# Altium project Motor Controller PCB.PrjPcb
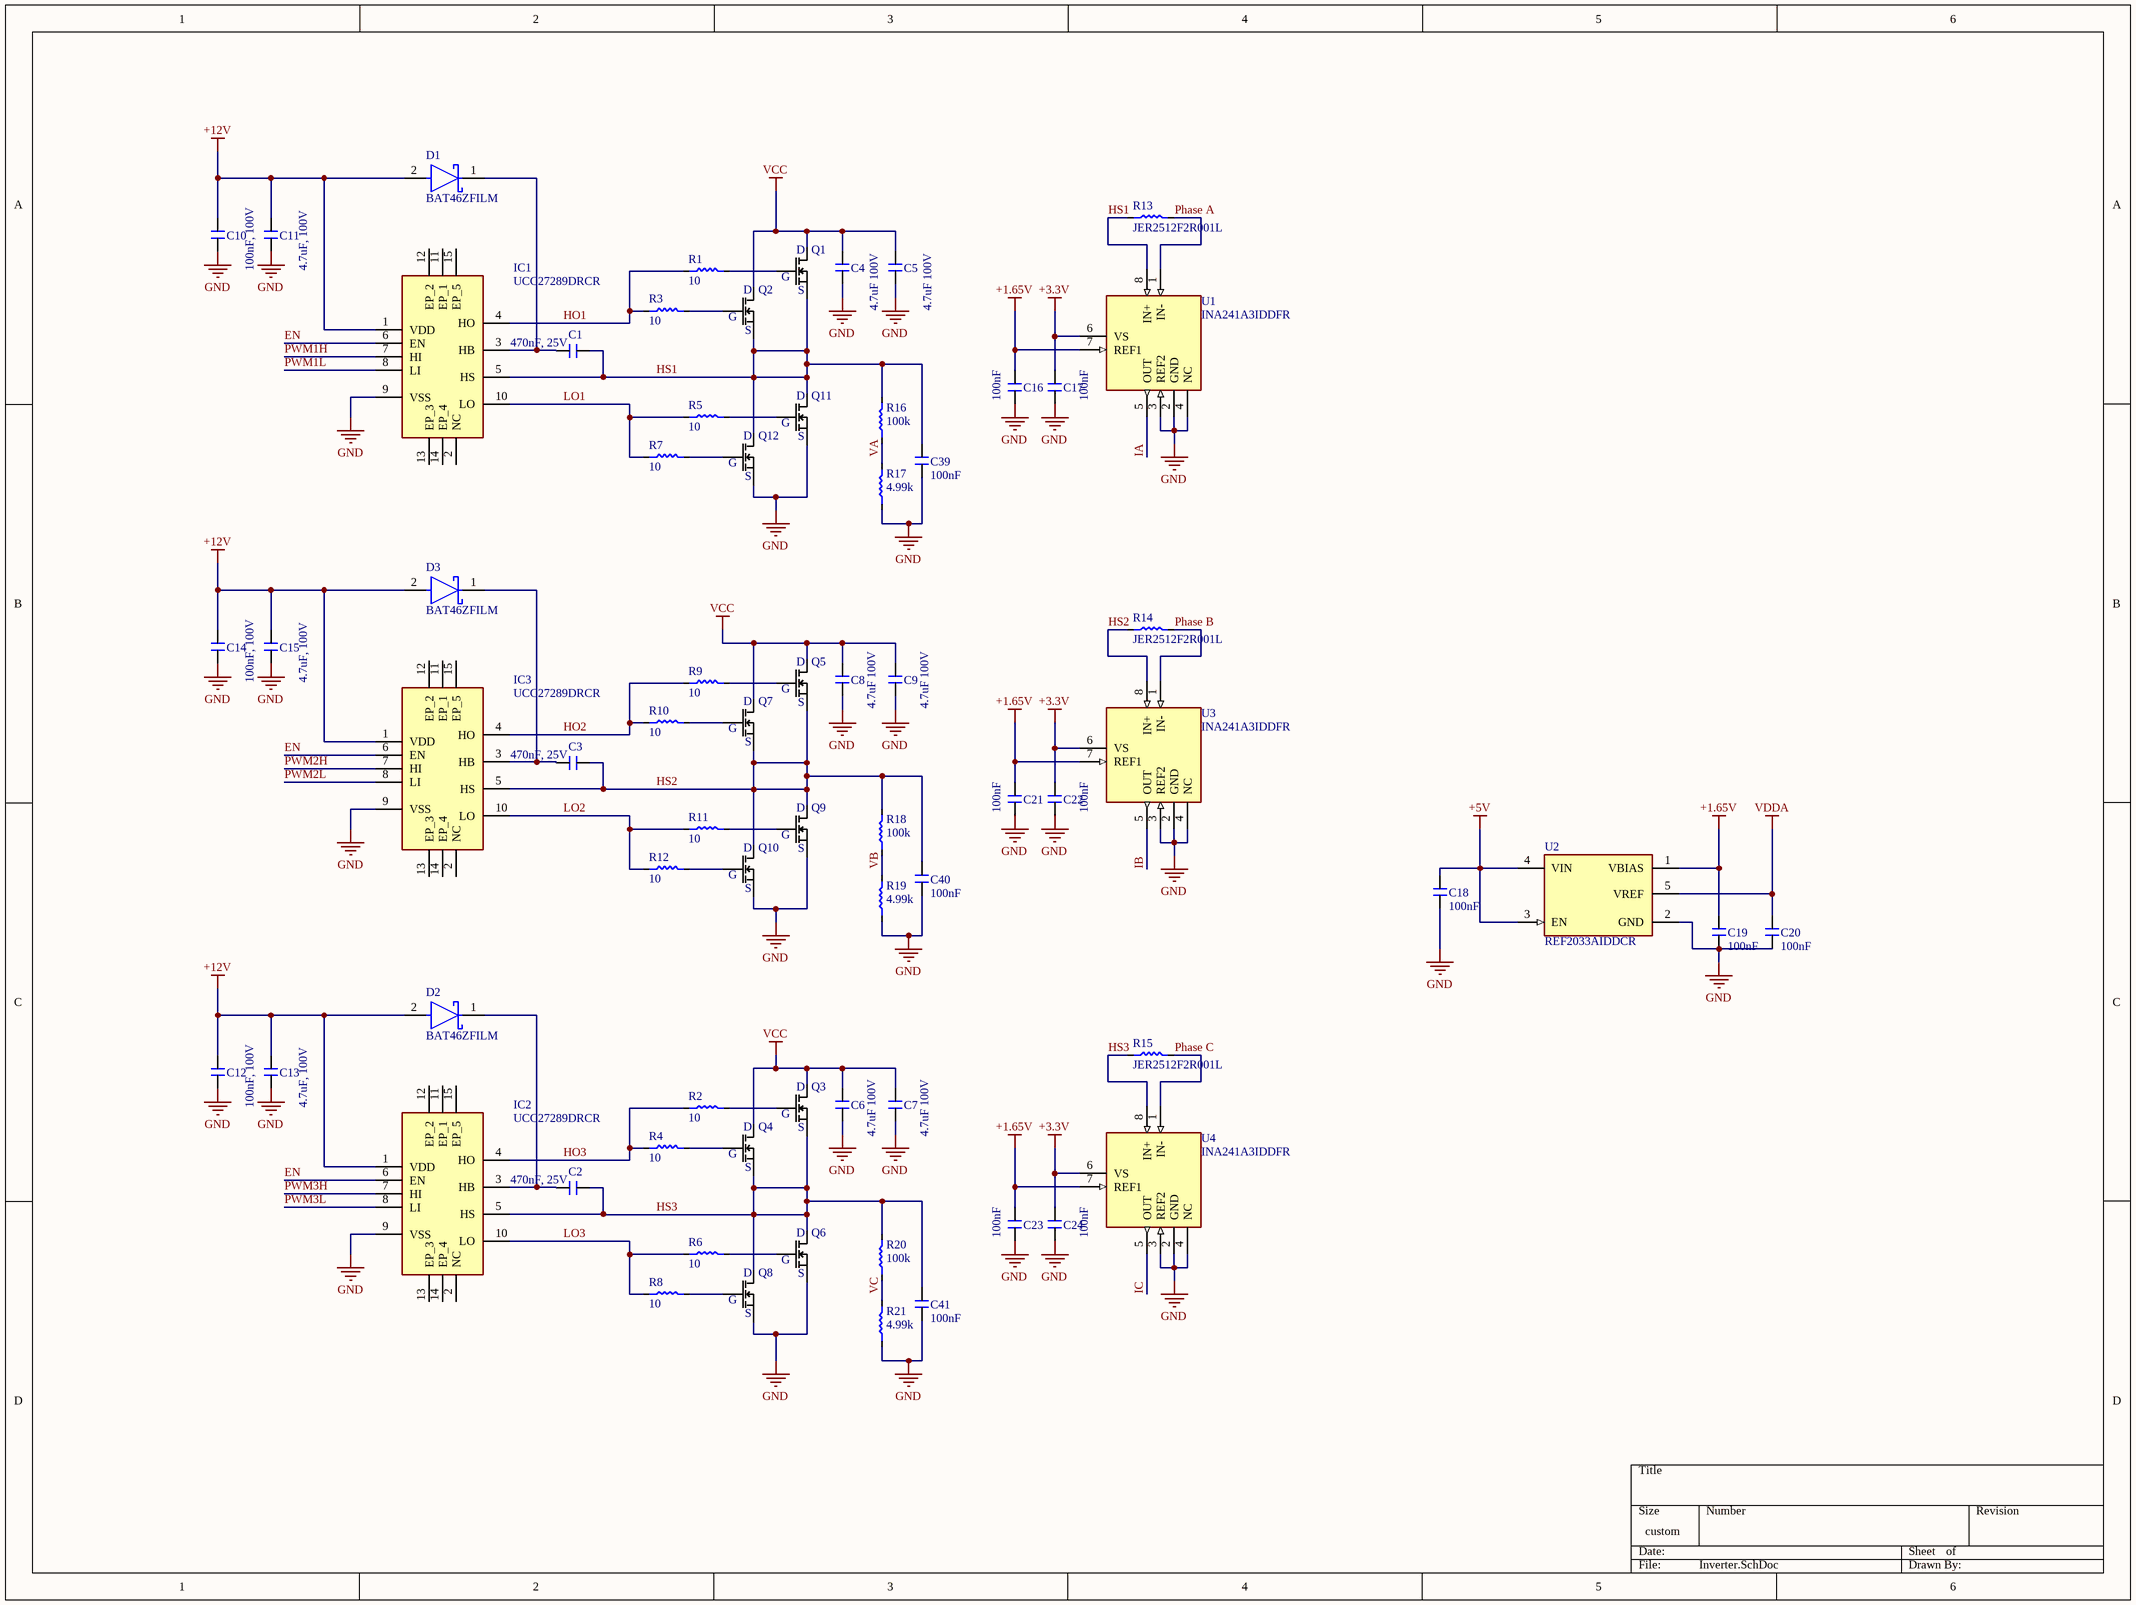
[diagram p0: Inverter.SchDoc]
4 sheets, 147 parts. Net scope: global (net labels, ports and power ports of the same name join across sheets).
Board file: Copy of Motor Controller.PcbDoc
Sheets:
  Inverter.SchDoc
  stm32f407.SchDoc
  Buck Converters.SchDoc
  Encoder.SchDoc

## Sheet Inverter.SchDoc
size 400 x 299 mm; SheetNumber: 1; SheetTotal: 2

### Parts
(Parts that share a designator on the sheet are numbered #1, #2 ... from top to bottom, then left to right.)
C1  470nF, 25V  [C_0805]
C2  470nF, 25V  [C_0805]
C3  470nF, 25V  [C_0805]
C4  4.7uF 100V  [C_1210]
C5  4.7uF 100V  [C_1210]
C6  4.7uF 100V  [C_1210]
C7  4.7uF 100V  [C_1210]
C8  4.7uF 100V  [C_1210]
C9  4.7uF 100V  [C_1210]
C10  100nF, 100V  [C_0805]
C11  4.7uF, 100V  [C_0805]
C12  100nF, 100V  [C_0805]
C13  4.7uF, 100V  [C_0805]
C14  100nF, 100V  [C_0805]
C15  4.7uF, 100V  [C_0805]
C16  100nF  [C_0603]
C17  100nF  [C_0603]
C18  100nF  [C_0603]
C19  100nF  [C_0603]
C20  100nF  [C_0603]
C21  100nF  [C_0603]
C22  100nF  [C_0603]
C23  100nF  [C_0603]
C24  100nF  [C_0603]
C39  100nF  [C_0603]
C40  100nF  [C_0603]
C41  100nF  [C_0603]
D1  BAT46ZFILM  [FP-SOD-123-MFG]
D2#1  BAT46ZFILM  [FP-SOD-123-MFG]
D3  BAT46ZFILM  [FP-SOD-123-MFG]
IC1#1  UCC27289DRCR  [TPS51200MDRCTEP]
IC2  UCC27289DRCR  [TPS51200MDRCTEP]
IC3  UCC27289DRCR  [TPS51200MDRCTEP]
Q1  BSZ075N08NS5ATMA1  [BSZ0909LSATMA1]  (value not drawn)
Q2  BSZ075N08NS5ATMA1  [BSZ0909LSATMA1]  (value not drawn)
Q3  BSZ075N08NS5ATMA1  [BSZ0909LSATMA1]  (value not drawn)
Q4  BSZ075N08NS5ATMA1  [BSZ0909LSATMA1]  (value not drawn)
Q5  BSZ075N08NS5ATMA1  [BSZ0909LSATMA1]  (value not drawn)
Q6  BSZ075N08NS5ATMA1  [BSZ0909LSATMA1]  (value not drawn)
Q7  BSZ075N08NS5ATMA1  [BSZ0909LSATMA1]  (value not drawn)
Q8  BSZ075N08NS5ATMA1  [BSZ0909LSATMA1]  (value not drawn)
Q9  BSZ075N08NS5ATMA1  [BSZ0909LSATMA1]  (value not drawn)
Q10  BSZ075N08NS5ATMA1  [BSZ0909LSATMA1]  (value not drawn)
Q11  BSZ075N08NS5ATMA1  [BSZ0909LSATMA1]  (value not drawn)
Q12  BSZ075N08NS5ATMA1  [BSZ0909LSATMA1]  (value not drawn)
R1  10  [R_0402]
R2  10  [R_0402]
R3  10  [R_0402]
R4  10  [R_0402]
R5  10  [R_0402]
R6  10  [R_0402]
R7  10  [R_0402]
R8  10  [R_0402]
R9  10  [R_0402]
R10  10  [R_0402]
R11  10  [R_0402]
R12  10  [R_0402]
R13  JER2512F2R001L  [JER2512F2R001L]
R14  JER2512F2R001L  [JER2512F2R001L]
R15  JER2512F2R001L  [JER2512F2R001L]
R16  100k  [R_0402]
R17  4.99k  [R_0402]
R18  100k  [R_0402]
R19  4.99k  [R_0402]
R20  100k  [R_0402]
R21  4.99k  [R_0402]
U1  INA241A3IDDFR  [SOT65P280X110-8N]
U2  REF2033AIDDCR  [FP-DDC0005A-MFG]
U3  INA241A3IDDFR  [SOT65P280X110-8N]
U4  INA241A3IDDFR  [SOT65P280X110-8N]

### Nets
+1.65V: C16.1 C19.1 C21.1 C23.1 U1.7(REF1) U2.1(VBIAS) U3.7(REF1) U4.7(REF1)
+3.3V: C17.1 C22.1 C24.1 U1.6(VS) U3.6(VS) U4.6(VS)
+5V: C18.1 U2.3(EN) U2.4(VIN)
+12V: C10.1 C11.1 C12.1 C13.1 C14.1 C15.1 D1.2(A) D2#1.2(A) D3.2(A) IC1#1.1(VDD) IC2.1(VDD) IC3.1(VDD)
GND: C4.2 C5.2 C6.2 C7.2 C8.2 C9.2 C10.2 C11.2 C12.2 C13.2 C14.2 C15.2 C16.2 C17.2 C18.2 C19.2 C20.2 C21.2 C22.2 C23.2 C24.2 C39.2 C40.2 C41.2 IC1#1.9(VSS) IC2.9(VSS) IC3.9(VSS) Q6.1,2,3,10(S_1) Q8.1,2,3,10(S_1) Q9.1,2,3,10(S_1) Q10.1,2,3,10(S_1) Q11.1,2,3,10(S_1) Q12.1,2,3,10(S_1) R17.2 R19.2 R21.2 U1.2(GND) U1.3(REF2) U1.4(NC) U2.2(GND) U3.2(GND) U3.3(REF2) U3.4(NC) U4.2(GND) U4.3(REF2) U4.4(NC)
VCC: C4.1 C5.1 C6.1 C7.1 C8.1 C9.1 Q1.5,6,7,8,9(D) Q2.5,6,7,8,9(D) Q3.5,6,7,8,9(D) Q4.5,6,7,8,9(D) Q5.5,6,7,8,9(D) Q7.5,6,7,8,9(D)
VDDA: C20.1 U2.5(VREF)
EN: IC1#1.6(EN) IC2.6(EN) IC3.6(EN)
HO1: IC1#1.4(HO) R1.2 R3.2
HO2: IC3.4(HO) R9.2 R10.2
HO3: IC2.4(HO) R2.2 R4.2
HS1: C1.1 C39.1 IC1#1.5(HS) Q1.1,2,3,10(S_1) Q2.1,2,3,10(S_1) Q11.5,6,7,8,9(D) Q12.5,6,7,8,9(D) R13.2 R16.1 U1.8(IN+)
HS2: C3.1 C40.1 IC3.5(HS) Q5.1,2,3,10(S_1) Q7.1,2,3,10(S_1) Q9.5,6,7,8,9(D) Q10.5,6,7,8,9(D) R14.2 R18.1 U3.8(IN+)
HS3: C2.1 C41.1 IC2.5(HS) Q3.1,2,3,10(S_1) Q4.1,2,3,10(S_1) Q6.5,6,7,8,9(D) Q8.5,6,7,8,9(D) R15.2 R20.1 U4.8(IN+)
IA: U1.5(OUT)
IB: U3.5(OUT)
IC: U4.5(OUT)
LO1: IC1#1.10(LO) R5.2 R7.2
LO2: IC3.10(LO) R11.2 R12.2
LO3: IC2.10(LO) R6.2 R8.2
Phase A: R13.1 U1.1(IN-)
Phase B: R14.1 U3.1(IN-)
Phase C: R15.1 U4.1(IN-)
PWM1H: IC1#1.7(HI)
PWM1L: IC1#1.8(LI)
PWM2H: IC3.7(HI)
PWM2L: IC3.8(LI)
PWM3H: IC2.7(HI)
PWM3L: IC2.8(LI)
VA: R16.2 R17.1
VB: R18.2 R19.1
VC: R20.2 R21.1
NetC1_2: C1.2 D1.1(C) IC1#1.3(HB)
NetC2_2: C2.2 D2#1.1(C) IC2.3(HB)
NetC3_2: C3.2 D3.1(C) IC3.3(HB)
NetQ1_4: Q1.4(G) R1.1
NetQ2_4: Q2.4(G) R3.1
NetQ3_4: Q3.4(G) R2.1
NetQ4_4: Q4.4(G) R4.1
NetQ5_4: Q5.4(G) R9.1
NetQ6_4: Q6.4(G) R6.1
NetQ7_4: Q7.4(G) R10.1
NetQ8_4: Q8.4(G) R8.1
NetQ9_4: Q9.4(G) R11.1
NetQ10_4: Q10.4(G) R12.1
NetQ11_4: Q11.4(G) R5.1
NetQ12_4: Q12.4(G) R7.1

Not connected (* = marked no-connect by the designer): IC1#1 2(NC) 11(EP_1) 12(EP_2) 13(EP_3) 14(EP_4) 15(EP_5); IC2 2(NC) 11(EP_1) 12(EP_2) 13(EP_3) 14(EP_4) 15(EP_5); IC3 2(NC) 11(EP_1) 12(EP_2) 13(EP_3) 14(EP_4) 15(EP_5)

### Notes on the sheet
- (in symbol BSZ075N08NS5ATMA1) S

### Library data of the parts
C1-C3 C10-C15 = C_0805: Manufacturer Part No: *; JLCPCB Part No: *
C4-C9 = C_1210
C16-C24 C39-C41 = C_0603
D1 D2#1 D3 = CMP-12187-000006-1: DIODE SCHOTTKY 100V 150MA SOD123; Manufacturer: STMicroelectronics; Max Surge Forward Current: 1A; Capacitance: 10pF; Standoff Height: 0mm; Peak Reverse Current: 5uA; Value: 10pF; Max Junction Temp: +150°C; Automotive: No; Ipc Land Pattern Name: SOD375155X145-2; Device Class L2: Diodes; Device Class L1: Discrete Semiconductors; Temperature Range High: +150°C; ComponentLink2Description: Datasheet; Lead Free: Yes; Digikey Description: DIODE SCHOTTKY 100V 150MA SOD123; RoHS: TRUE; Category: Diode; Max Repetitive Reverse Voltage: 100V; ComponentLink2URL: https://www.st.com/resource/en/datasheet/bat46.pdf; Manufacturer Part Number: BAT46ZFILM; Temperature: to +150°C; Mouser Description: Schottky Diodes & Rectifiers schottky diode; Package: SOD-123; Forward Current: 150mA; Octopart: https://octopart.com/bat46zfilm-stmicroelectronics-658190; Height: 1.45mm; Device Class L3: Schottky Diodes
IC1#1 IC2 IC3 = UCC27289DRCR: Integrated Circuit; Manufacturer_Name: Texas Instruments; Datasheet Link: https://www.ti.com/lit/ds/symlink/ucc27289.pdf?ts=1715220331720&ref_url=https%253A%252F%252Fwww.mouser.tw%252F; Height: 1mm; Manufacturer_Part_Number: UCC27289DRCR; Mouser Part Number: 595-UCC27289DRCR; Mouser Price/Stock: https://www.mouser.co.uk/ProductDetail/Texas-Instruments/UCC27289DRCR?qs=rQFj71Wb1eUTx1xsT8GKBg%3D%3D
Q1-Q12 = BSZ075N08NS5ATMA1: MOSFET (N-Channel); Manufacturer_Name: Infineon; Datasheet Link: https://www.infineon.com/dgdl/Infineon-BSZ075N08NS5-DataSheet-v02_03-EN.pdf?fileId=5546d461454603990145ccd5743e61f8; Height: 1mm; Manufacturer_Part_Number: BSZ075N08NS5ATMA1; Mouser Part Number: 726-BSZ075N08NS5ATMA; Mouser Price/Stock: https://www.mouser.co.uk/ProductDetail/Infineon-Technologies/BSZ075N08NS5ATMA1?qs=3Bi3m9r5MQbCecwbz%252BCetA%3D%3D; Arrow Part Number: BSZ075N08NS5ATMA1; Arrow Price/Stock: https://www.arrow.com/en/products/bsz075n08ns5atma1/infineon-technologies-ag?utm_currency=USD&region=nac
R1-R12 R16-R21 = R_0402
R13-R15 = JER2512F2R001L: RES 1mΩ ±1% 2W 2512; Manufacturer Part No: JIERR JER2512F2R001L; LCSC Part No: C49164682
U1 U3 U4 = INA241A3IDDFR: -5-V to 110-V bidirectional ultraprecise current sense amplifier with enhanced PWM rejection; MF: Texas Instruments; Package: None; Price: None; Check_prices: https://www.snapeda.com/parts/INA241A3IDDFR/Texas+Instruments/view-part/?ref=eda; Value: *; SnapEDA_Link: https://www.snapeda.com/parts/INA241A3IDDFR/Texas+Instruments/view-part/?ref=snap; MP: INA241A3IDDFR; Availability: In Stock; Purchase-URL: https://pricing.snapeda.com/search?q=INA241A3IDDFR&ref=eda
U2 = CMP-04916-000008-1: IC VREF SERIES 1.65V/3.3V 5SOT; Manufacturer: Texas Instruments; Standoff Height: 0mm; Nominal Supply Current: 360uA; Min Supply Voltage: 3.32V; Output Type: Fixed; Number Of Outputs: 2; Output Voltage: 1.65/3.3V; Output Current: 20mA; Max Supply Voltage: 5.5V; Max Junction Temp: +150°C; Automotive: No; Height: 1.1mm; Package: DDC0005A; Reference Type: Series; Manufacturer Part Number: REF2033AIDDCR; Temperature Range High: +125°C; Lead Free: Yes; ComponentLink2Description: Datasheet; Device Class L1: Integrated Circuits (ICs); Category: IC; RoHS: TRUE; Device Class L3: Voltage References; ComponentLink2URL: http://www.ti.com/lit/ds/symlink/ref2033.pdf; Device Class L2: Power Management ICs; Octopart: https://octopart.com/ref2033aiddcr-texas+instruments-46921199; Digikey Description: IC VREF SERIES 1.65V/3.3V 5SOT; Temperature: -40°C to +125°C; Temperature Range Low: -40°C

## Sheet stm32f407.SchDoc
size 599 x 241 mm; SheetNumber: 2; SheetTotal: 4
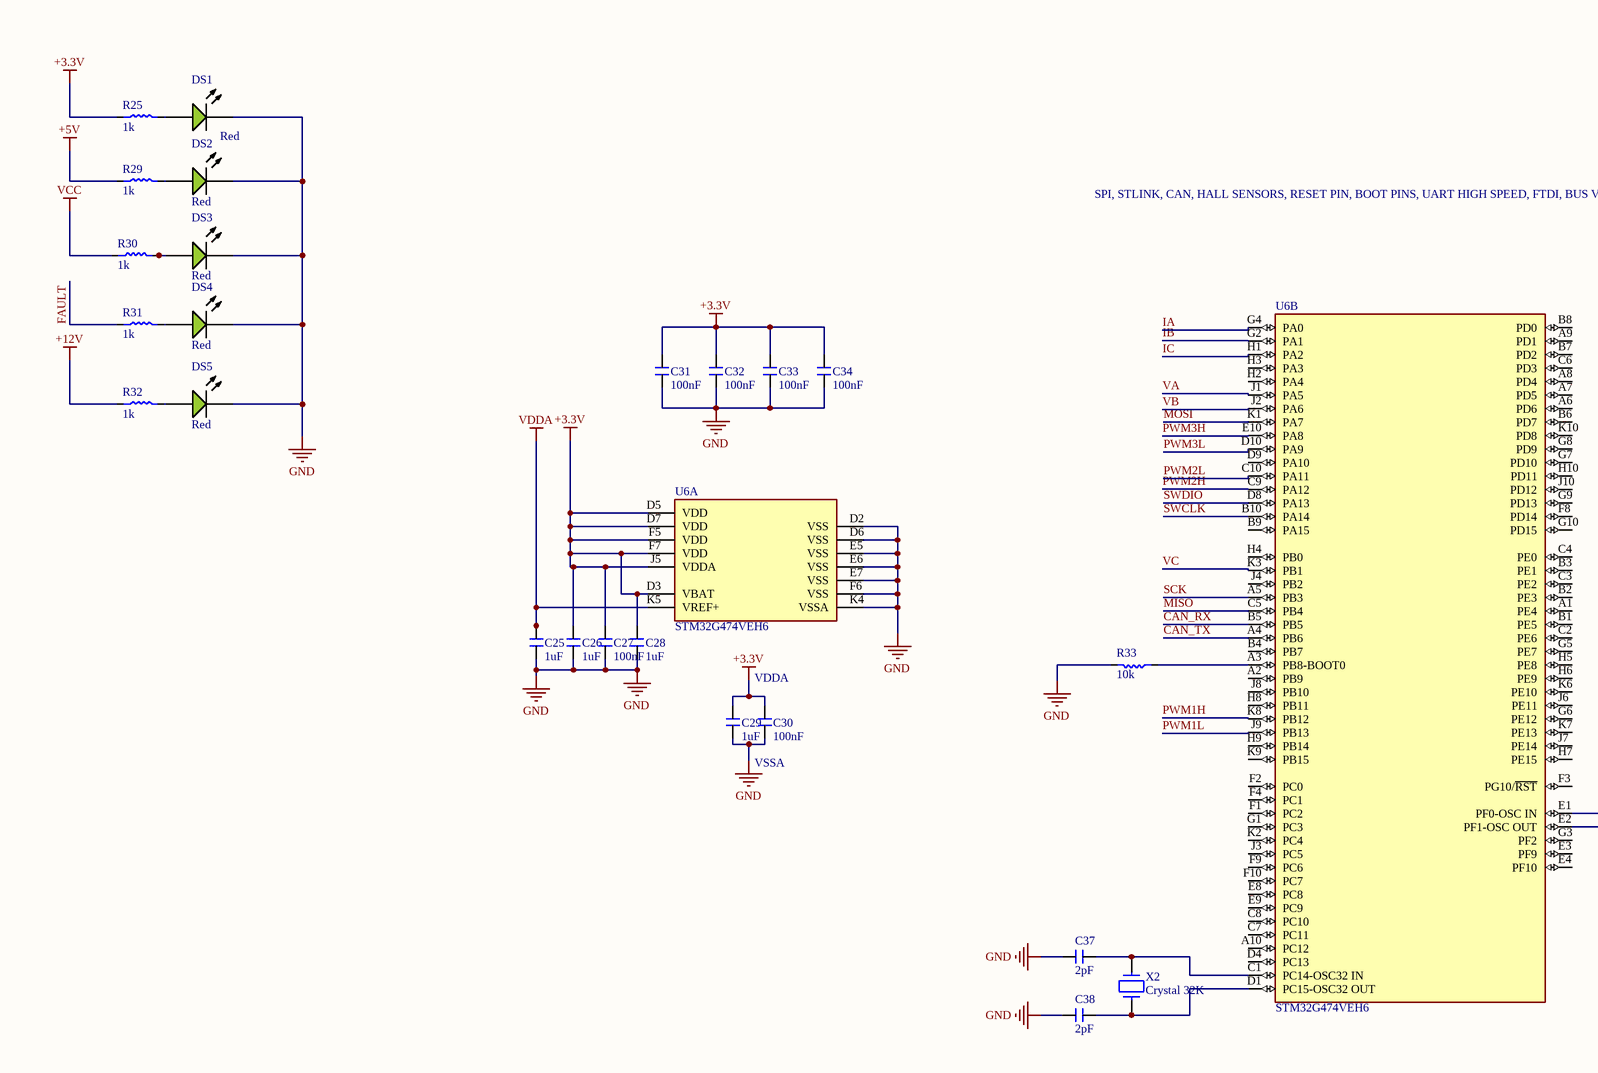
[diagram p1: stm32f407.SchDoc, left]
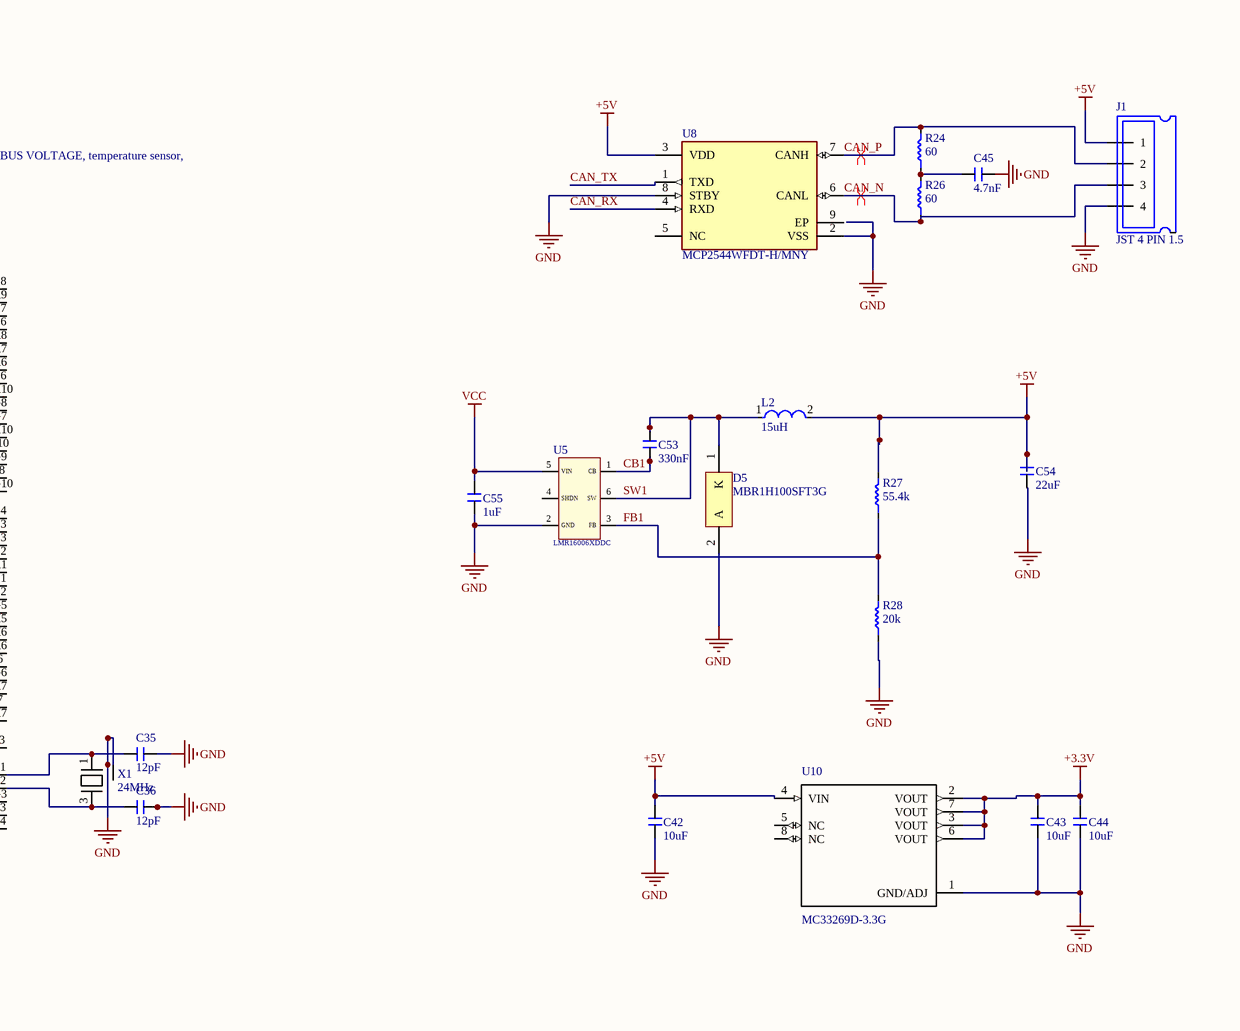
[diagram p2: stm32f407.SchDoc, right]

### Parts
C25  1uF  [C_0402]
C26  1uF  [C_0402]
C27  100nF  [C_0402]
C28  1uF  [C_0402]
C29  1uF  [C_0402]
C30  100nF  [C_0402]
C31  100nF  [C_0402]
C32  100nF  [C_0402]
C33  100nF  [C_0402]
C34  100nF  [C_0402]
C35  12pF  [C_0402]
C36  12pF  [C_0402]
C37  2pF  [C_0402]
C38  2pF  [C_0402]
C42  10uF  [C_0805]
C43  10uF  [C_0805]
C44  10uF  [C_0805]
C45  4.7nF  [C_0402]
C53  330nF  [C_0402]
C54  22uF  [C_0402]
C55  1uF  [C_0402]
D5  MBR1H100SFT3G  [ONSC-SOD-123FL-2-498-01_V]
DS1  Red  [EVRL-0603-2_V]
DS2  Red  [EVRL-0603-2_V]
DS3  Red  [EVRL-0603-2_V]
DS4  Red  [EVRL-0603-2_V]
DS5  Red  [EVRL-0603-2_V]
J1  JST 4 PIN 1.5  [JST 4 PIN 1.5]
L2  15uH  [FP-IHLP-2020CZ-FP_1_905x2-MFG]
R24  60  [R_0402]
R25  1k  [R_0402]
R26  60  [R_0402]
R27  55.4k  [R_0402]
R28  20k  [R_0402]
R29  1k  [R_0402]
R30  1k  [R_0402]
R31  1k  [R_0402]
R32  1k  [R_0402]
R33  10k  [R_0402]
U5  LMR16006XDDC  [SOT95P280X110-6N]  (value not drawn)
U6  STM32G474VEH6  [FP-TFBGA100-A08Q-MFG]  (parts A,B of 2)
U8  MCP2544WFDT-H/MNY  [FP-C04-129-MNY-MFG]
U10  MC33269D-3.3G  [*SOIC127P600X175-8N]
X1  24MHz  [24MHz Crystal]
X2  Crystal 32K  [Crystal 32k]

### Nets
+3.3V: C26.1 C27.2 C28.2 C29.1 C30.2 C31.1 C32.1 C33.1 C34.1 C43.1 C44.1 R25.2 U6.D3(VBAT) U6.D5(VDD) U6.D7(VDD) U6.F5(VDD) U6.F7(VDD) U6.J5(VDDA) U10.2(VOUT) U10.3(VOUT) U10.6(VOUT) U10.7(VOUT)
+5V: C42.1 C54.1 J1.1 L2.2 R27.1 R29.2 U8.3(VDD) U10.4(VIN)
+12V: R32.2
GND: C25.2 C26.2 C27.1 C28.1 C29.2 C30.1 C31.2 C32.2 C33.2 C34.2 C35.2 C36.1 C37.2 C38.1 C42.2 C43.2 C44.2 C45.2 C54.2 C55.2 D5.2(A) DS1.2(K) DS2.2(K) DS3.2(K) DS4.2(K) DS5.2(K) J1.4 R28.2 R33.1 U5.2(GND) U6.D2(VSS) U6.D6(VSS) U6.E5(VSS) U6.E6(VSS) U6.E7(VSS) U6.F6(VSS) U6.K4(VSSA) U8.2(VSS) U8.8(STBY) U10.1(GND/ADJ) X1.2 X1.4
VCC: C55.1 R30.2 U5.5(VIN)
VDDA: C25.1 U6.K5(VREF+)
CAN_N: J1.3 R26.2 U8.6(CANL)
CAN_P: J1.2 R24.1 U8.7(CANH)
CAN_RX: U6.B5(PB5) U8.4(RXD)
CAN_TX: U6.A4(PB6) U8.1(TXD)
CB1: C53.2 U5.1(CB)
FAULT: R31.2
FB1: R27.2 R28.1 U5.3(FB)
IA: U6.G4(PA0)
IB: U6.G2(PA1)
IC: U6.H1(PA2)
MISO: U6.C5(PB4)
MOSI: U6.K1(PA7)
PWM1H: U6.K8(PB12)
PWM1L: U6.J9(PB13)
PWM2H: U6.C9(PA12)
PWM2L: U6.C10(PA11)
PWM3H: U6.E10(PA8)
PWM3L: U6.D10(PA9)
SCK: U6.A5(PB3)
SW1: C53.1 D5.1(K) L2.1 U5.6(SW)
SWCLK: U6.B10(PA14)
SWDIO: U6.D8(PA13)
VA: U6.J1(PA5)
VB: U6.J2(PA6)
VC: U6.K3(PB1)
NetC35_1: C35.1 U6.E1(PF0-OSC_IN) X1.1
NetC36_2: C36.2 U6.E2(PF1-OSC_OUT) X1.3
NetC37_1: C37.1 U6.C1(PC14-OSC32_IN) X2.2
NetC38_2: C38.2 U6.D1(PC15-OSC32_OUT) X2.1
NetC45_1: C45.1 R24.2 R26.1
NetDS1_1: DS1.1(A) R25.1
NetDS2_1: DS2.1(A) R29.1
NetDS3_1: DS3.1(A) R30.1
NetDS4_1: DS4.1(A) R31.1
NetDS5_1: DS5.1(A) R32.1
NetR33_2: R33.2 U6.A3(PB8-BOOT0)

Not connected (* = marked no-connect by the designer): U5 4(SHDN); U6 A1(PE4) A2(PB9) A6(PD6) A7(PD5) A8(PD4) A9(PD1) A10(PC12) B1(PE5) B2(PE3) B3(PE1) B4(PB7) B6(PD7) B7(PD2) B8(PD0) B9(PA15) C2(PE6) C3(PE2) C4(PE0) C6(PD3) C7(PC11) C8(PC10) D4(PC13) D9(PA10) E3(PF9) E4(PF10) E8(PC8) E9(PC9) F1(PC2) F2(PC0) F3(PG10/~{RST}) F4(PC1) F8(PD14) F9(PC6) F10(PC7) G1(PC3) G3(PF2) G5(PE7) G6(PE12) G7(PD10) G8(PD9) G9(PD13) G10(PD15) H2(PA4) H3(PA3) H4(PB0) H5(PE8) H6(PE9) H7(PE15) H8(PB11) H9(PB14) H10(PD11) J3(PC5) J4(PB2) J6(PE11) J7(PE14) J8(PB10) J10(PD12) K2(PC4) K6(PE10) K7(PE13) K9(PB15) K10(PD8); U8 5(NC) 9(EP); U10 5(NC) 8(NC)

### Layout directives
differential pair: CAN_N, CAN_P

### Notes on the sheet
- SPI, STLINK, CAN, HALL SENSORS, RESET PIN, BOOT PINS, UART HIGH SPEED, FTDI, BUS VOLTAGE, temperature sensor,
- VDDA
- VSSA

### Library data of the parts
C25-C38 C45 C53-C55 = C_0402
C42-C44 = C_0805: Manufacturer Part No: *; JLCPCB Part No: *
D5 = CMP-1055-00439-1: Schottky Power Rectifier, 2-Pin SOD-123, Pb-Free, Tape and Reel; Manufacturer: On Semiconductor; IFSM Max (A): 50; Configuration: Single; Mounting Technology: Surface Mount; ComponentLink2Description: Datasheet; ComponentLink3Description: Package Specification; Packing: Tape and Reel; RoHS: TRUE; PartNumber: MBR1H100SFT3G; PackageDescription: 2-Pin SOD, Body 1.65 x 2.7 mm; ComponentLink1Description: Manufacturer URL; ComponentLink2URL: http://www.onsemi.cn/pub_link/Collateral/MBR1H100SF-D.PDF; ComponentLink3URL: http://www.onsemi.cn/pub_link/Collateral/MBR120VLSFT1-D.PDF; PackageVersion: Rev. A; DatasheetVersion: Rev. 1; ComponentLink1URL: http://www.onsemi.com/; PackageReference: SOD-123FL-2-498-01
DS1 = CMP-007-00002-2: Chip LED, Yellow-Green, 5 V, 25 mA, -40 to 85 degC, 2-Pin SMD (0603), RoHS, Tape and Reel; Manufacturer: Everlight Electronics; Forward Voltage: 2V; Lens Style: Clear; Viewing Angle: 120degrees; Colour: Green; Parameter 1: XL-1608SURC-06; Parameter 2: C965799; Mounting Technology: SM; Datasheet Version: Rev. 1, 04/2006; Package Description: 2-Pin Surface Mount Device, Body 1.6 x 0.8 mm; RoHS Compliant: True; Package Reference: 0603; Pins: 2; Manufacturer URL: http://www.everlight.com/; Datasheet URL: https://datasheet.ciiva.com/48679/19-217-g7c-an1p2-3t-48679179.pdf; Case/Package: 0603
DS2-DS5 = CMP-007-00002-2: Chip LED, Yellow-Green, 5 V, 25 mA, -40 to 85 degC, 2-Pin SMD (0603), RoHS, Tape and Reel; Manufacturer: Everlight Electronics; Forward Voltage: 2V; Lens Style: Clear; Viewing Angle: 120degrees; Colour: Green; Mounting Technology: SM; Datasheet Version: Rev. 1, 04/2006; Package Description: 2-Pin Surface Mount Device, Body 1.6 x 0.8 mm; RoHS Compliant: True; Package Reference: 0603; Pins: 2; Manufacturer URL: http://www.everlight.com/; Datasheet URL: https://datasheet.ciiva.com/48679/19-217-g7c-an1p2-3t-48679179.pdf; Case/Package: 0603
L2 = CMP-02424-000144-1: Fixed Inductors Commercial High Saturation Series 15uH 1.9A 265mΩ 20%; Test Frequency: 100kHz; DC Resistance (DCR): 265mR; Saturation Current: 2.5A; Core Material: Metal; Self Resonant Frequency: 5MHz; Shielding: Shielded; Case/Package: 2020; Current Rating: 1.9A; Inductance: 15uH; Height: 3mm; Max Operating Temperature: 125°C; Military Standard: Not; Package Quantity: 2000; Tolerance: 20%; Depth: 5.43mm; Packaging: Tape and Reel; Lead Free: Lead Free; Min Operating Temperature: -55°C; Radiation Hardening: No; Mount: Surface Mount; Height - Seated (Max): 0.118inch; Length: 5.49mm; Width: 0.204inch; Termination: SMD/SMT; Max DC Current: 2.5A
R24-R33 = R_0402
U6 = CMP-12105-000111-1: IC MCU 32BIT 512KB FLSH 100TFBGA; RoHS Compliant: Yes
U8 = CMP-06279-000053-1: IC TRANSCEIVER 1/1 8TDFN; Data Rate: 8Mbps; Receiver Hysteresis: 200mV; RoHS Compliant: Yes; Packaging: Cut Tape; Max Operating Temperature: 150°C; Min Operating Temperature: -40°C; Series: -; Mount: Surface Mount
X1 = 24MHz Crystal
U10 = MC33269D-3.3G: SnapEDA_Link: https://www.snapeda.com/parts/MC33269D-3.3G/Onsemi/view-part/?ref=snap; Check_prices: https://www.snapeda.com/parts/MC33269D-3.3G/Onsemi/view-part/?ref=eda; Value: *

## Sheet Buck Converters.SchDoc
size B; SheetNumber: 3; SheetTotal: 3
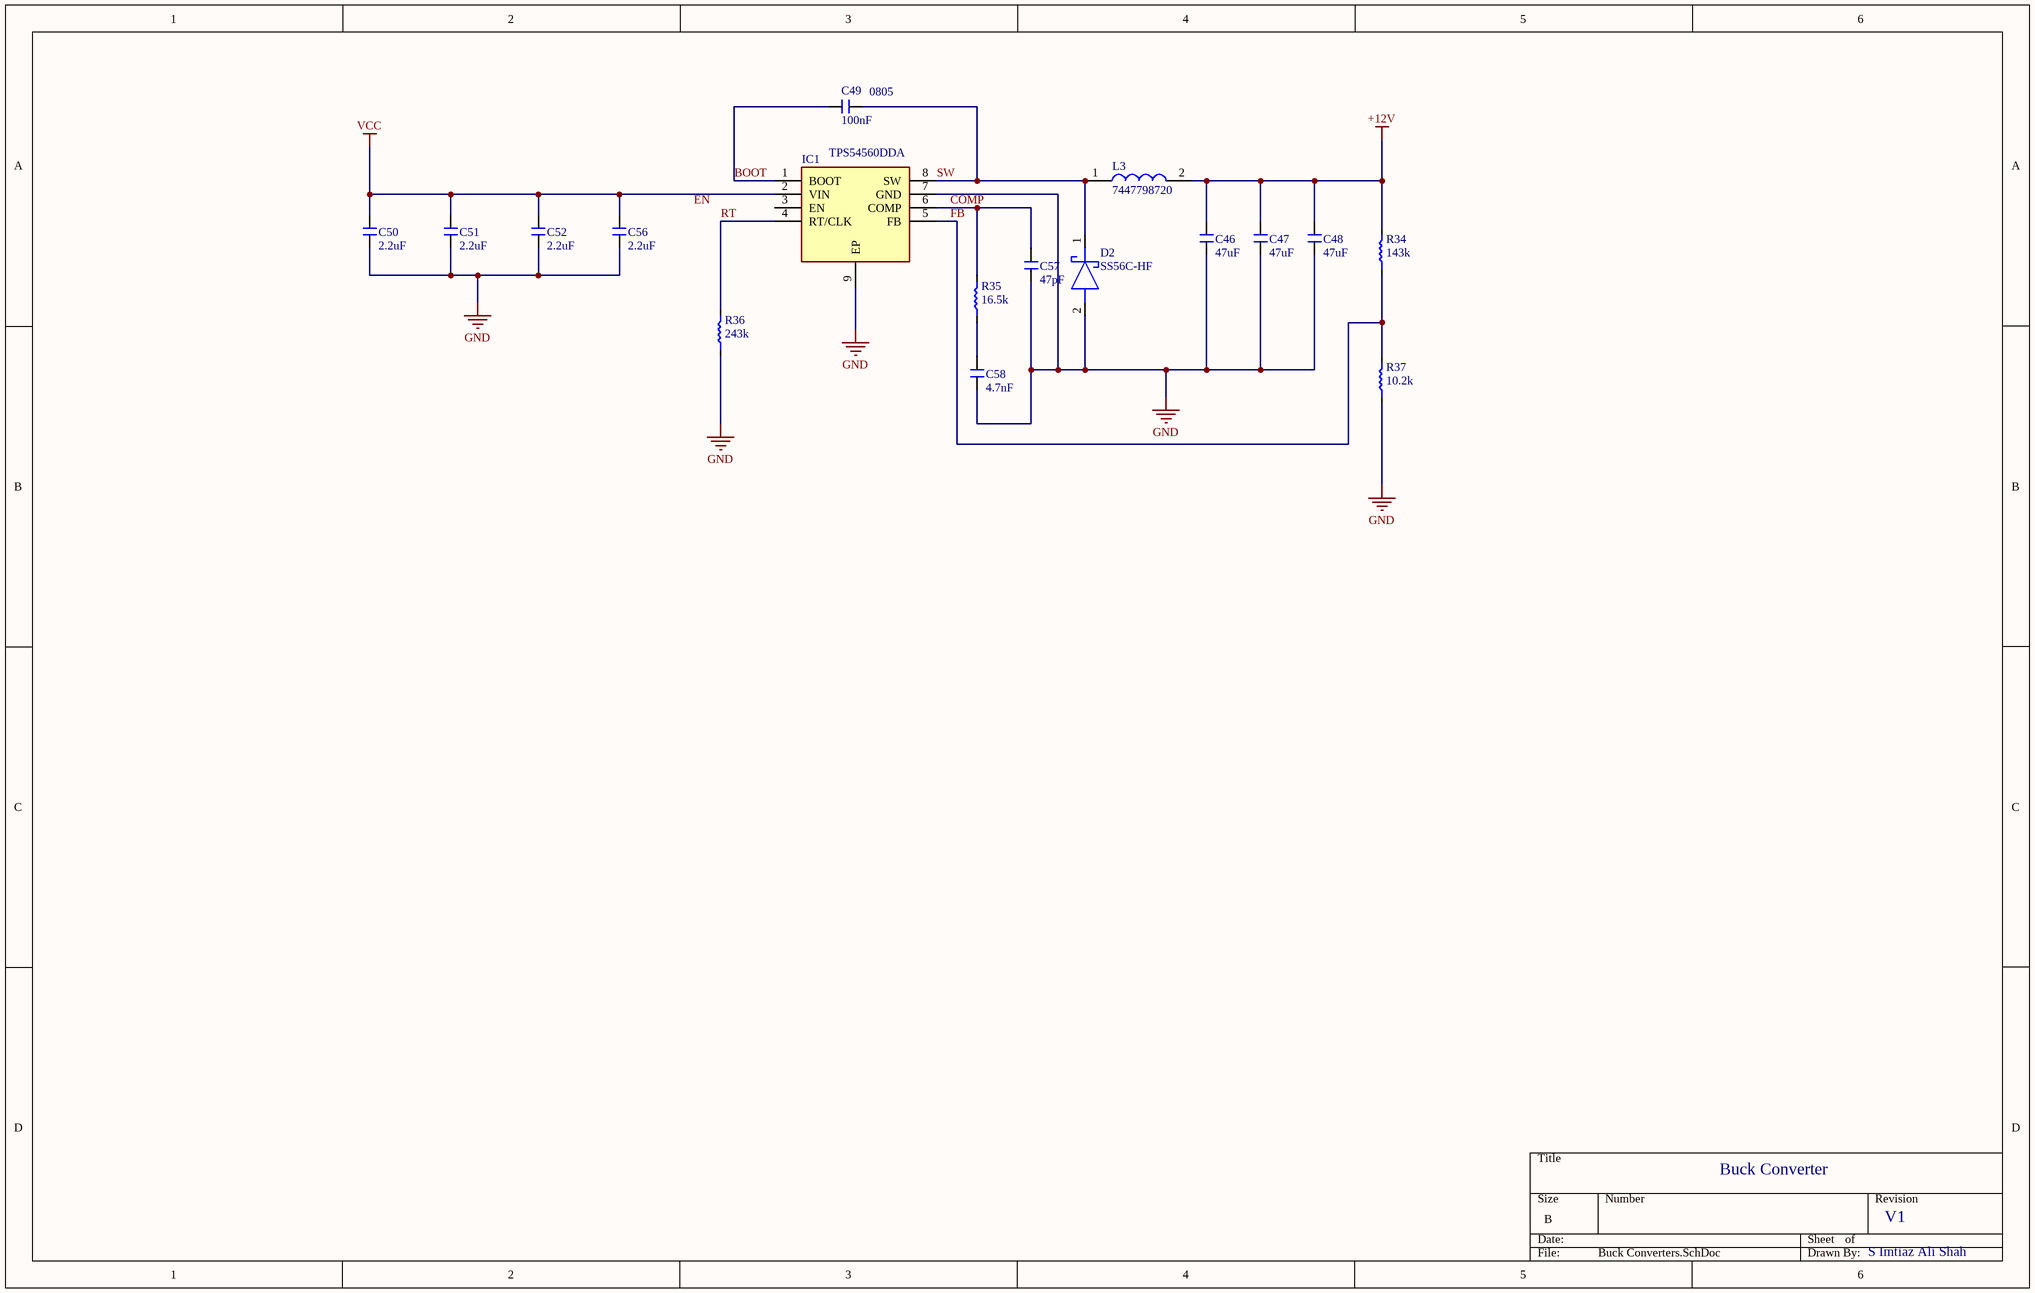
[diagram p3: Buck Converters.SchDoc]

### Parts
(Parts that share a designator on the sheet are numbered #1, #2 ... from top to bottom, then left to right.)
C46  47uF  [C_0603]
C47  47uF  [C_0603]
C48  47uF  [C_0603]
C49  100nF  [C_0603]
C50  2.2uF  [C_0603]
C51  2.2uF  [C_0603]
C52  2.2uF  [C_0603]
C56  2.2uF  [C_0603]
C57  47pF  [C_0402]
C58  4.7nF  [C_0402]
D2#2  SS56C-HF  [DIOM7859X239N]
IC1#2  TPS54560DDA  [SOIC127P600X170-9N]
L3  7447798720  [7447797360]
R34  143k  [R_0402]
R35  16.5k  [R_0402]
R36  243k  [R_0402]
R37  10.2k  [R_0402]

### Nets
+12V: C46.1 C47.1 C48.1 L3.2 R34.1
GND: C46.2 C47.2 C48.2 C50.2 C51.2 C52.2 C56.2 C57.2 C58.2 D2#2.2(A) IC1#2.7(GND) IC1#2.9(EP) R36.2 R37.2
VCC: C50.1 C51.1 C52.1 C56.1 IC1#2.2(VIN)
BOOT: C49.1 IC1#2.1(BOOT)
COMP: C57.1 IC1#2.6(COMP) R35.1
FB: IC1#2.5(FB) R34.2 R37.1
RT: IC1#2.4(RT/CLK) R36.1
SW: C49.2 D2#2.1(K) IC1#2.8(SW) L3.1
NetC58_1: C58.1 R35.2

Not connected (* = marked no-connect by the designer): IC1#2 3(EN)

### Notes on the sheet
- (near C49) 0805
- Buck Converter
- V1
- S Imtiaz Ali Shah
- Labels drawn without touching a wire or pin: EN

### Library data of the parts
C46-C52 C56 = C_0603
C57 C58 = C_0402
D2#2 = SS56C-HF: Schottky Diode; Manufacturer_Name: Comchip Technology; Parameter 1: B560C-13-F; Parameter 2: C85100; Datasheet Link: https://www.comchiptech.com/admin/files/product/20190806171902.pdf; Height: 2.39mm; Manufacturer_Part_Number: SS56C-HF; Mouser Part Number: 750-SS56C-HF; Mouser Price/Stock: https://www.mouser.co.uk/ProductDetail/Comchip-Technology/SS56C-HF?qs=GBLSl2AkirseVC5DPICxbA%3D%3D; Arrow Part Number: SS56C-HF; Arrow Price/Stock: https://www.arrow.com/en/products/ss56c-hf/comchip-technology?region=nac
IC1#2 = TPS54560DDA: Integrated Circuit; Manufacturer_Name: Texas Instruments; Parameter 2: C7420431; Parameter 3: C31966; Datasheet Link: http://www.ti.com/lit/ds/symlink/tps54560.pdf; Height: 1.7mm; Manufacturer_Part_Number: TPS54560DDA; Mouser Part Number: 595-TPS54560DDA; Mouser Price/Stock: https://www.mouser.co.uk/ProductDetail/Texas-Instruments/TPS54560DDA?qs=%2FA2SZCkL4TkCDiLMkQe1zw%3D%3D; Arrow Part Number: TPS54560DDA; Arrow Price/Stock: https://www.arrow.com/en/products/tps54560dda/texas-instruments?utm_currency=USD&region=nac; Parameter 1: TPS54560DDA
L3 = 7447798720: Inductor; Manufacturer_Name: Wurth Elektronik; Height: 4.5mm; Manufacturer_Part_Number: 7447798720; Mouser Part Number: 710-7447798720; Mouser Price/Stock: https://www.mouser.co.uk/ProductDetail/Wurth-Elektronik/7447798720?qs=E%2F%2FhvbtCqpOcNhO9pFvFww%3D%3D
R34-R37 = R_0402

## Sheet Encoder.SchDoc
size A; SheetNumber: 4; SheetTotal: 4
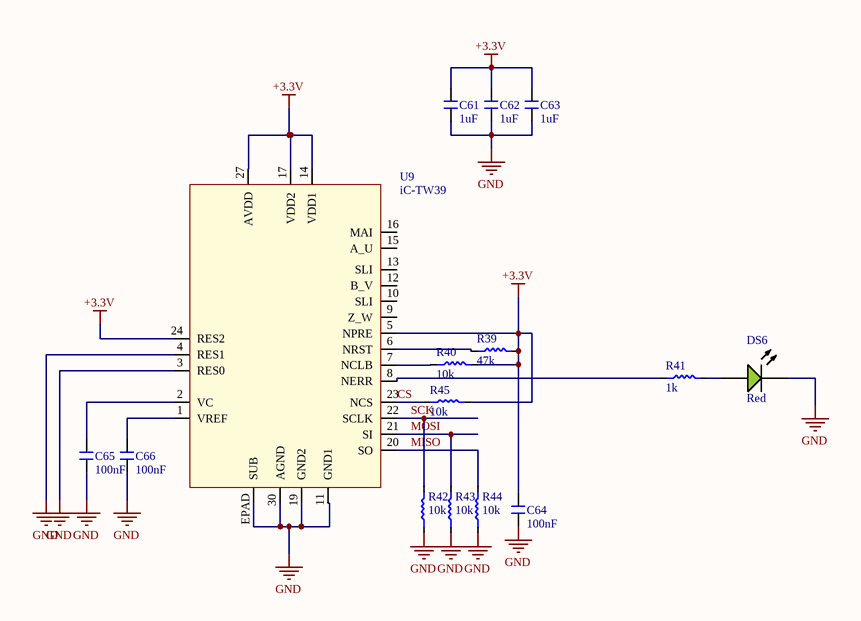
[diagram p4: Encoder.SchDoc]

### Parts
C61  1uF  [C_0402]
C62  1uF  [C_0402]
C63  1uF  [C_0402]
C64  100nF  [C_0402]
C65  100nF  [C_0402]
C66  100nF  [C_0402]
DS6  Red  [EVRL-0603-2_V]
R39  47k  [R_0402]
R40  10k  [R_0402]
R41  1k  [R_0402]
R42  10k  [R_0402]
R43  10k  [R_0402]
R44  10k  [R_0402]
R45  10k  [R_0402]
U9  iC-TW39  [iC-TW39]

### Nets
+3.3V: C61.2 C62.2 C63.2 C64.2 R39.1 R40.1 R45.1 U9.5(NPRE) U9.14(VDD1) U9.17(VDD2) U9.24(RES2) U9.27(AVDD)
GND: C61.1 C62.1 C63.1 C64.1 C65.1 C66.1 DS6.2(K) R42.2 R43.2 R44.2 U9.3(RES0) U9.4(RES1) U9.11(GND1) U9.19(GND2) U9.30(AGND) U9.EPAD(SUB)
CS: R45.2 U9.23(NCS)
MISO: R44.1 U9.20(SO)
MOSI: R43.1 U9.21(SI)
SCK: R42.1 U9.22(SCLK)
NetC65_2: C65.2 U9.2(VC)
NetC66_2: C66.2 U9.1(VREF)
NetDS6_1: DS6.1(A) R41.1
NetR39_2: R39.2 U9.6(NRST)
NetR40_2: R40.2 U9.7(NCLB)
NetR41_2: R41.2 U9.8(NERR)

Not connected (* = marked no-connect by the designer): U9 9(Z_W) 10(SLI) 12(B_V) 13(SLI) 15(A_U) 16(MAI)

### Library data of the parts
C61-C66 = C_0402
DS6 = CMP-007-00002-2: as DS2 on sheet stm32f407; Mounting Technology: SM; Datasheet Version: Rev. 1, 04/2006; Package Description: 2-Pin Surface Mount Device, Body 1.6 x 0.8 mm; RoHS Compliant: True; Package Reference: 0603; Pins: 2; Manufacturer URL: http://www.everlight.com/; Datasheet URL: https://datasheet.ciiva.com/48679/19-217-g7c-an1p2-3t-48679179.pdf; Case/Package: 0603
R39-R45 = R_0402

## Nets that join several sheets
+3.3V: Inverter (6 pins), stm32f407 (22 pins), Encoder (12 pins)
+5V: Inverter (C18.1 U2.3 U2.4), stm32f407 (8 pins)
+12V: Inverter (12 pins), stm32f407 (R32.2), Buck Converters (5 pins)
GND: Inverter (46 pins), stm32f407 (42 pins), Buck Converters (14 pins), Encoder (16 pins)
VCC: Inverter (12 pins), stm32f407 (C55.1 R30.2 U5.5), Buck Converters (5 pins)
VDDA: Inverter (C20.1 U2.5), stm32f407 (C25.1 U6.K5)
IA: Inverter (U1.5), stm32f407 (U6.G4)
IB: Inverter (U3.5), stm32f407 (U6.G2)
IC: Inverter (U4.5), stm32f407 (U6.H1)
MISO: stm32f407 (U6.C5), Encoder (R44.1 U9.20)
MOSI: stm32f407 (U6.K1), Encoder (R43.1 U9.21)
PWM1H: Inverter (IC1#1.7), stm32f407 (U6.K8)
PWM1L: Inverter (IC1#1.8), stm32f407 (U6.J9)
PWM2H: Inverter (IC3.7), stm32f407 (U6.C9)
PWM2L: Inverter (IC3.8), stm32f407 (U6.C10)
PWM3H: Inverter (IC2.7), stm32f407 (U6.E10)
PWM3L: Inverter (IC2.8), stm32f407 (U6.D10)
SCK: stm32f407 (U6.A5), Encoder (R42.1 U9.22)
VA: Inverter (R16.2 R17.1), stm32f407 (U6.J1)
VB: Inverter (R18.2 R19.1), stm32f407 (U6.J2)
VC: Inverter (R20.2 R21.1), stm32f407 (U6.K3)